# Altium schematic sheet FPGA.SchDoc
size A4; SheetNumber: 2; SheetTotal: 4
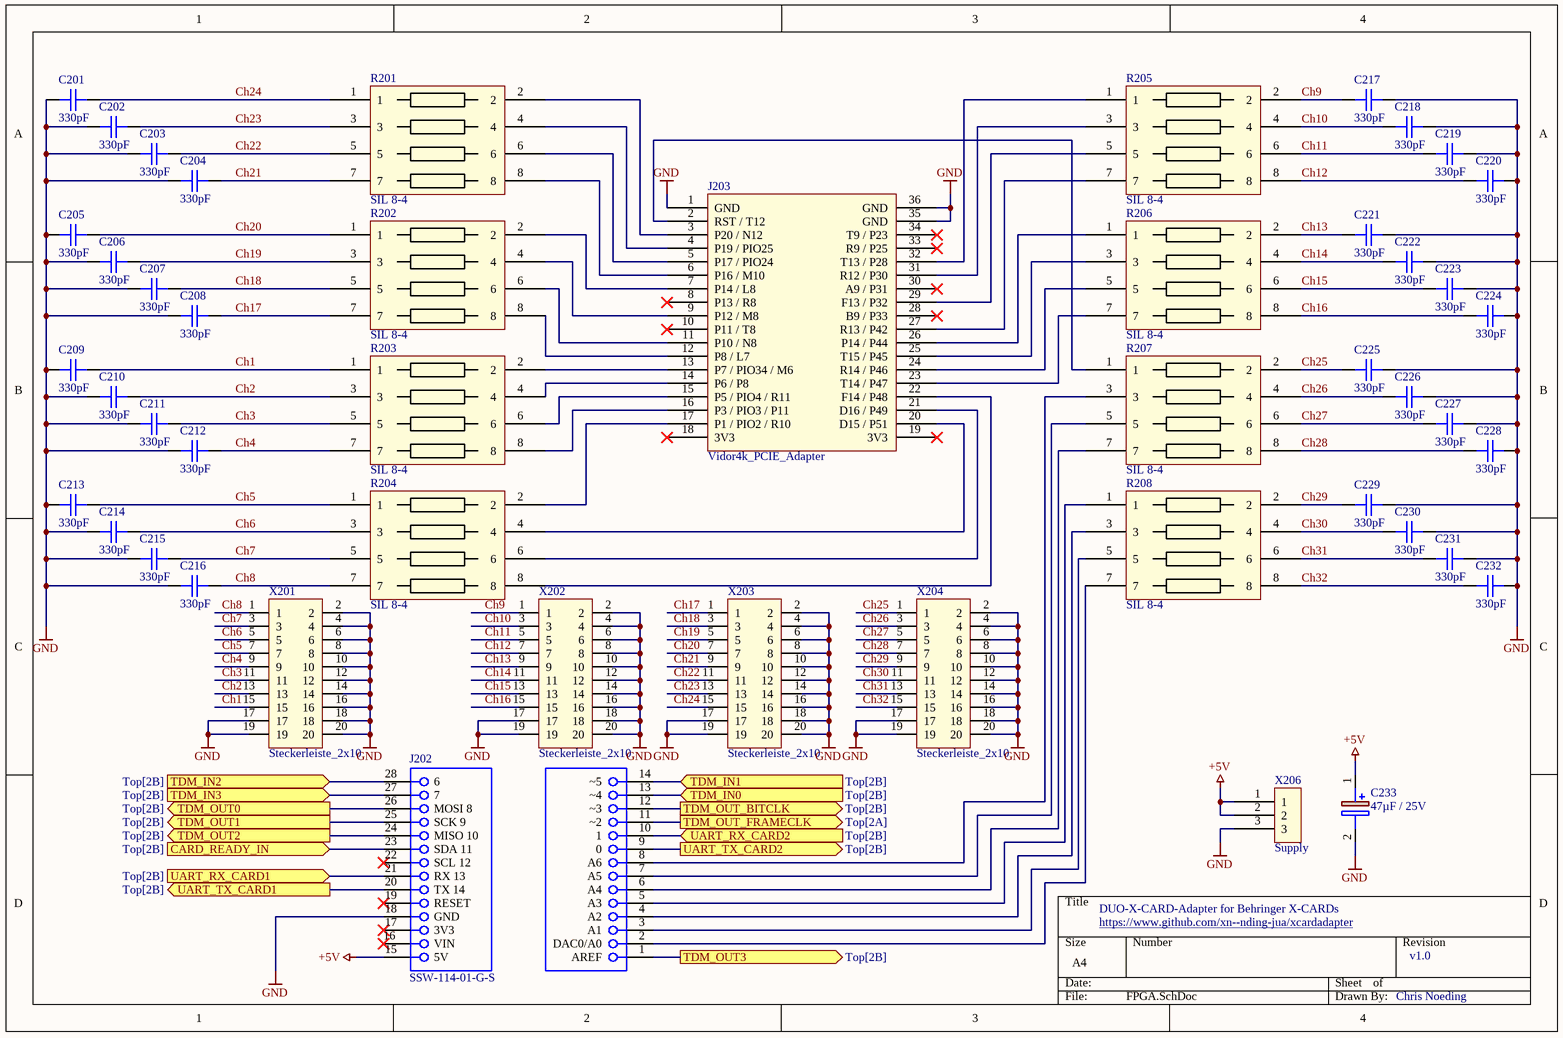
[diagram p0: FPGA.SchDoc]

## Parts
C201  330pF  [1206]
C202  330pF  [1206]
C203  330pF  [1206]
C204  330pF  [1206]
C205  330pF  [1206]
C206  330pF  [1206]
C207  330pF  [1206]
C208  330pF  [1206]
C209  330pF  [1206]
C210  330pF  [1206]
C211  330pF  [1206]
C212  330pF  [1206]
C213  330pF  [1206]
C214  330pF  [1206]
C215  330pF  [1206]
C216  330pF  [1206]
C217  330pF  [1206]
C218  330pF  [1206]
C219  330pF  [1206]
C220  330pF  [1206]
C221  330pF  [1206]
C222  330pF  [1206]
C223  330pF  [1206]
C224  330pF  [1206]
C225  330pF  [1206]
C226  330pF  [1206]
C227  330pF  [1206]
C228  330pF  [1206]
C229  330pF  [1206]
C230  330pF  [1206]
C231  330pF  [1206]
C232  330pF  [1206]
C233  47µF / 25V  [CAPPRD200W50D550H1250]
J202  SSW-114-01-G-S  [SMTC-SSW-114-01-X-S]
J203  Vidor4k_PCIE_Adapter  [Vidor4K_PCIE_Adapter]
R201  SIL 8-4  [SIL8]
R202  SIL 8-4  [SIL8]
R203  SIL 8-4  [SIL8]
R204  SIL 8-4  [SIL8]
R205  SIL 8-4  [SIL8]
R206  SIL 8-4  [SIL8]
R207  SIL 8-4  [SIL8]
R208  SIL 8-4  [SIL8]
X201  Steckerleiste_2x10  [steckerleiste_2x10]
X202  Steckerleiste_2x10  [steckerleiste_2x10]
X203  Steckerleiste_2x10  [steckerleiste_2x10]
X204  Steckerleiste_2x10  [steckerleiste_2x10]
X206  Supply  [1x3 Jumper]

## Ports
CARD_READY_IN (in, see Top[2B]), TDM_IN0 (in, see Top[2B]), TDM_IN1 (in, see Top[2B]), TDM_IN2 (in, see Top[2B]), TDM_IN3 (in, see Top[2B]), TDM_OUT0 (out, see Top[2B]), TDM_OUT1 (out, see Top[2B]), TDM_OUT2 (out, see Top[2B]), TDM_OUT3 (out, see Top[2B]), TDM_OUT_BITCLK (out, see Top[2B]), TDM_OUT_FRAMECLK (out, see Top[2A]), UART_RX_CARD1 (in, see Top[2B]), UART_RX_CARD2 (in, see Top[2B]), UART_TX_CARD1 (out, see Top[2B]), UART_TX_CARD2 (out, see Top[2B])

## Nets
+5V: C233.1(+) J202.15(5V) X206.1 X206.2
GND: C201.2 C202.2 C203.2 C204.2 C205.2 C206.2 C207.2 C208.2 C209.2 C210.2 C211.2 C212.2 C213.2 C214.2 C215.2 C216.2 C217.1 C218.1 C219.1 C220.1 C221.1 C222.1 C223.1 C224.1 C225.1 C226.1 C227.1 C228.1 C229.1 C230.1 C231.1 C232.1 C233.2(-) J202.18(GND) J203.1(GND) J203.35(GND) J203.36(GND) X201.2 X201.4 X201.6 X201.8 X201.10 X201.12 X201.14 X201.16 X201.17 X201.18 X201.19 X201.20 X202.2 X202.4 X202.6 X202.8 X202.10 X202.12 X202.14 X202.16 X202.17 X202.18 X202.19 X202.20 X203.2 X203.4 X203.6 X203.8 X203.10 X203.12 X203.14 X203.16 X203.17 X203.18 X203.19 X203.20 X204.2 X204.4 X204.6 X204.8 X204.10 X204.12 X204.14 X204.16 X204.17 X204.18 X204.19 X204.20 X206.3
CARD_READY_IN: J202.23(SDA_11) ; port CARD_READY_IN
Ch1: C209.1 R203.1 X201.15
Ch2: C210.1 R203.3 X201.13
Ch3: C211.1 R203.5 X201.11
Ch4: C212.1 R203.7 X201.9
Ch5: C213.1 R204.1 X201.7
Ch6: C214.1 R204.3 X201.5
Ch7: C215.1 R204.5 X201.3
Ch8: C216.1 R204.7 X201.1
Ch9: C217.2 R205.2 X202.1
Ch10: C218.2 R205.4 X202.3
Ch11: C219.2 R205.6 X202.5
Ch12: C220.2 R205.8 X202.7
Ch13: C221.2 R206.2 X202.9
Ch14: C222.2 R206.4 X202.11
Ch15: C223.2 R206.6 X202.13
Ch16: C224.2 R206.8 X202.15
Ch17: C208.1 R202.7 X203.1
Ch18: C207.1 R202.5 X203.3
Ch19: C206.1 R202.3 X203.5
Ch20: C205.1 R202.1 X203.7
Ch21: C204.1 R201.7 X203.9
Ch22: C203.1 R201.5 X203.11
Ch23: C202.1 R201.3 X203.13
Ch24: C201.1 R201.1 X203.15
Ch25: C225.2 R207.2 X204.1
Ch26: C226.2 R207.4 X204.3
Ch27: C227.2 R207.6 X204.5
Ch28: C228.2 R207.8 X204.7
Ch29: C229.2 R208.2 X204.9
Ch30: C230.2 R208.4 X204.11
Ch31: C231.2 R208.6 X204.13
Ch32: C232.2 R208.8 X204.15
TDM_IN0: J202.13(~4) ; port TDM_IN0
TDM_IN1: J202.14(~5) ; port TDM_IN1
TDM_IN2: J202.28(6) ; port TDM_IN2
TDM_IN3: J202.27(7) ; port TDM_IN3
TDM_OUT0: J202.26(MOSI_8) ; port TDM_OUT0
TDM_OUT1: J202.25(SCK_9) ; port TDM_OUT1
TDM_OUT2: J202.24(MISO_10) ; port TDM_OUT2
TDM_OUT3: J202.1(AREF) ; port TDM_OUT3
TDM_OUT_BITCLK: J202.12(~3) ; port TDM_OUT_BITCLK
TDM_OUT_FRAMECLK: J202.11(~2) ; port TDM_OUT_FRAMECLK
UART_RX_CARD1: J202.21(RX_13) ; port UART_RX_CARD1
UART_RX_CARD2: J202.10(1) ; port UART_RX_CARD2
UART_TX_CARD1: J202.20(TX_14) ; port UART_TX_CARD1
UART_TX_CARD2: J202.9(0) ; port UART_TX_CARD2
NetJ202_2: J202.2(DAC0/A0) R208.7
NetJ202_3: J202.3(A1) R208.5
NetJ202_4: J202.4(A2) R208.3
NetJ202_5: J202.5(A3) R208.1
NetJ202_6: J202.6(A4) R207.7
NetJ202_7: J202.7(A5) R207.5
NetJ202_8: J202.8(A6) R207.3
NetJ203_2: J203.2(RST_/_T12) R207.1
NetJ203_3: J203.3(P20_/_N12) R201.2
NetJ203_4: J203.4(P19_/_PIO25) R201.4
NetJ203_5: J203.5(P17_/_PIO24) R201.6
NetJ203_6: J203.6(P16_/_M10) R201.8
NetJ203_7: J203.7(P14_/_L8) R202.2
NetJ203_9: J203.9(P12_/_M8) R202.4
NetJ203_11: J203.11(P10_/_N8) R202.6
NetJ203_12: J203.12(P8_/_L7) R202.8
NetJ203_13: J203.13(P7_/_PIO34_/_M6) R203.2
NetJ203_14: J203.14(P6_/_P8) R203.4
NetJ203_15: J203.15(P5_/_PIO4_/_R11) R203.6
NetJ203_16: J203.16(P3_/_PIO3_/_P11) R203.8
NetJ203_17: J203.17(P1_/_PIO2_/_R10) R204.2
NetJ203_20: J203.20(D15_/_P51) R204.4
NetJ203_21: J203.21(D16_/_P49) R204.6
NetJ203_22: J203.22(F14_/_P48) R204.8
NetJ203_23: J203.23(T14_/_P47) R206.7
NetJ203_24: J203.24(R14_/_P46) R206.5
NetJ203_25: J203.25(T15_/_P45) R206.3
NetJ203_26: J203.26(P14_/_P44) R206.1
NetJ203_27: J203.27(R13_/_P42) R205.7
NetJ203_29: J203.29(F13_/_P32) R205.5
NetJ203_31: J203.31(R12_/_P30) R205.3
NetJ203_32: J203.32(T13_/_P28) R205.1

Not connected (* = marked no-connect by the designer): J202 16(VIN)* 17(3V3)* 19(RESET)* 22(SCL_12)*; J203 8(P13_/_R8)* 10(P11_/_T8)* 18(3V3)* 19(3V3)* 28(B9_/_P33)* 30(A9_/_P31)* 33(R9_/_P25)* 34(T9_/_P23)*

## Notes on the sheet
- DUO-X-CARD-Adapter for Behringer X-CARDs
- https://www.github.com/xn--nding-jua/xcardadapter
- v1.0
- Chris Noeding

## Library data of the parts
C201-C232 = 1206_C_1nF/63V: 1206_C; Text Field1: 06-23225; SMA-ArtikelNr: *
C233 = MAL214256479E3: Capacitor Polarised; Manufacturer_Name: Vishay; Datasheet Link: https://www.vishay.com/docs/28402/142rhs.pdf; Height: 12.5mm; Manufacturer_Part_Number: MAL214256479E3
J202 = Arduino MKR Vidor 4000: SQ Post Socket, Through-hole, Vertical, -55 to 125 degC, 2.54 mm Pitch, 14-Pin, Female, RoHS; Manufacturer: Samtec; Pitch: 2.54 mm; PackageVersion: CA, 6/1987; Mounting Technology: Through-hole; Temperature Range: -55 to 125 degC; Orientation: Vertical; PackageDescription: Assembly, Socket Strip .016 X .031 Tail; ComponentLink1URL: http://www.samtec.com; ComponentLink2URL: http://www.samtec.com/documents/webfiles/pdf/SSW_TH.PDF; ComponentLink1Description: Manufacturer URL; ComponentLink3Description: Package Specification; ComponentLink3URL: http://www.samtec.com/documents/webfiles/cpdf/SSW-1XX-XX-XXX-X-XX-XXX-XX-MKT.pdf; ComponentLink2Description: Datasheet; RoHS: True; PartNumber: SSW-114-01-G-S; PackageReference: SSW-114-01-X-S; DatasheetVersion: F-214
X206 = 1x3 Jumper